# Altium schematic sheet nrf52840.SchDoc
size 381 x 241 mm; SheetNumber: 5; SheetTotal: 5
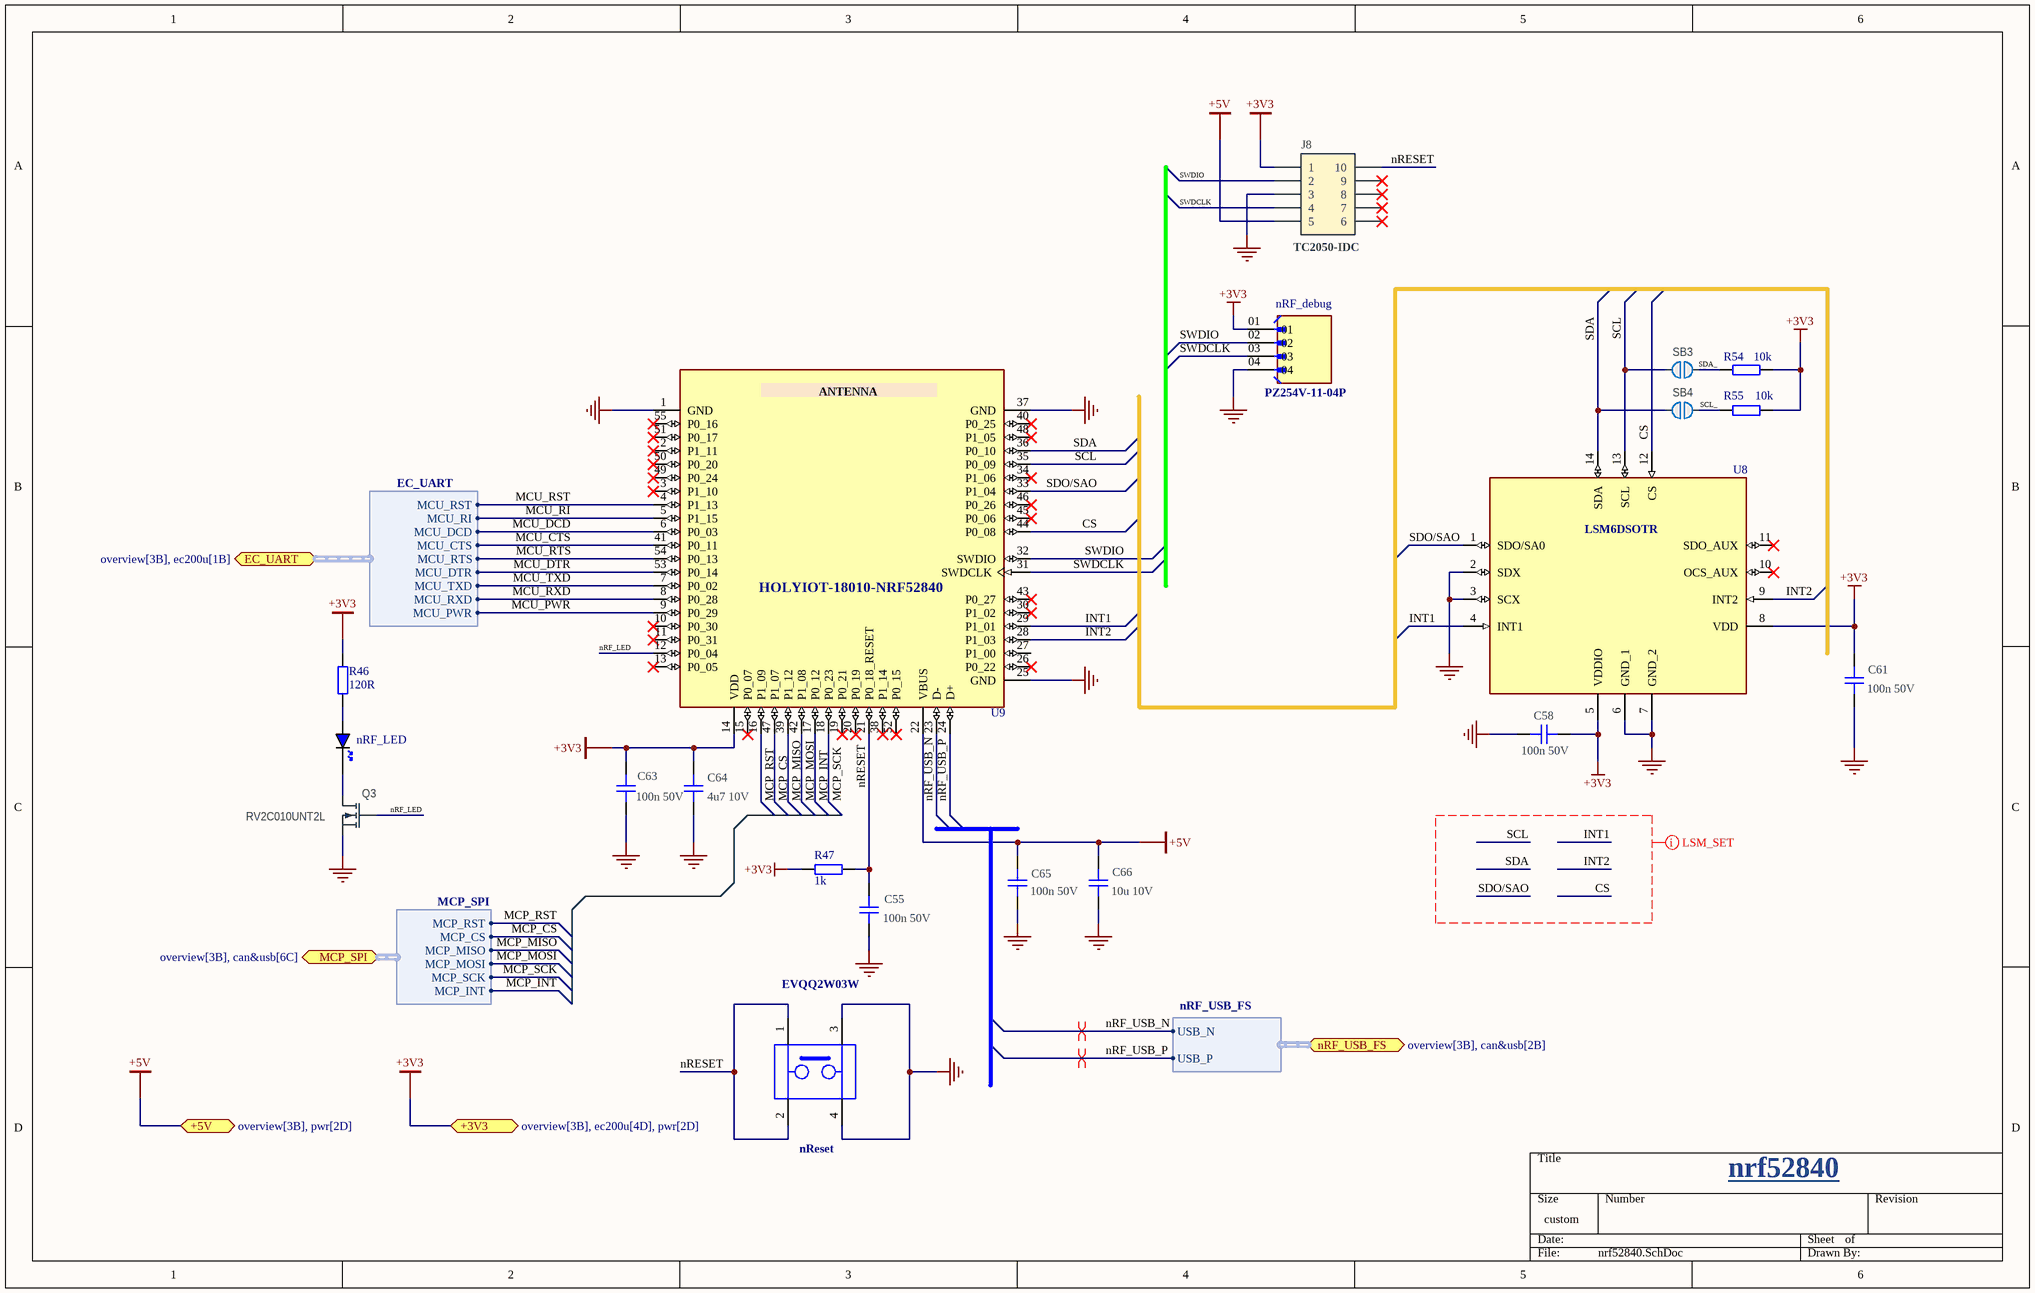
[diagram p0: nrf52840.SchDoc]

## Parts
C55  100n 50V  [CAPC1005X04L]
C58  100n 50V  [CAPC1005X04L]
C61  100n 50V  [CAPC1005X04L]
C63  100n 50V  [CAPC1005X04L]
C64  4u7 10V  [CAPC1005X04L]
C65  100n 50V  [CAPC1005X04L]
C66  10u 10V  [CAPC1005X04L]
J8  TC2050-IDC  [TC2050-IDC-NLFP]  (no BOM)
nReset  EVQQ2W03W  [EVQQ2W03W]
nRF_debug  PZ254V-11-04P  [SAMTEC_TSW-104-08-T-S-LL]
nRF_LED  BLUE  [LED_0603_BLUE]  (value not drawn)
Q3  RV2C010UNT2L  [DFN65P100X40-3L]
R46  120R  [RES_0603]
R47  1k  [RES_0603]
R54  10k  [RES_0603]
R55  10k  [RES_0603]
SB3  Solderbridge  [Solderbridge]  (value not drawn)  (no BOM)
SB4  Solderbridge  [Solderbridge]  (value not drawn)  (no BOM)
U8  LSM6DSOTR  [LSM6DSOTR]
U9  HOLYIOT-18010-NRF52840  [XCVR_HOLYIOT-18010-NRF52840]

## Ports
+3V3 (bidir, see overview[3B], ec200u[4D], pwr[2D]), +5V (bidir, see overview[3B], pwr[2D]), EC_UART (bidir, harness EC_UART, see overview[3B], ec200u[1B]), MCP_SPI (bidir, harness MCP_SPI, see overview[3B], can&usb[6C]), nRF_USB_FS (bidir, harness nRF_USB_FS, see overview[3B], can&usb[2B])

## Harnesses
EC_UART: MCU_RI, MCU_DCD, MCU_CTS, MCU_RTS, MCU_DTR, MCU_TXD, MCU_RXD, MCU_RST, MCU_PWR
nRF_USB_FS: USB_N, USB_P
MCP_SPI: MCP_RST, MCP_CS, MCP_MISO, MCP_MOSI, MCP_SCK, MCP_INT

## Nets
+3V3: C58.2 C61.1 C63.2 C64.2 J8.1 nRF_debug.01 R46.2 R47.1 R54.2 R55.2 U8.5(VDDIO) U8.8(VDD) U9.14(VDD) ; port +3V3
+5V: C65.2 C66.2 J8.5 U9.22(VBUS) ; port +5V
GND: C55.1 C58.1 C61.2 C63.1 C64.1 C65.1 C66.1 J8.3 nReset.3 nReset.4 nRF_debug.04 Q3.2(S) U8.2(SDX) U8.3(SCX) U8.6(GND_1) U8.7(GND_2) U9.1(GND) U9.25(GND) U9.37(GND)
CS: U8.12(CS) U9.44(P0_08)
INT1: U8.4(INT1) U9.29(P1_01)
INT2: U8.9(INT2) U9.28(P1_03)
MCP_CS: U9.47(P1_07) ; port MCP_SPI.MCP_CS
MCP_INT: U9.17(P0_12) ; port MCP_SPI.MCP_INT
MCP_MISO: U9.39(P1_12) ; port MCP_SPI.MCP_MISO
MCP_MOSI: U9.42(P1_08) ; port MCP_SPI.MCP_MOSI
MCP_RST: U9.16(P1_09) ; port MCP_SPI.MCP_RST
MCP_SCK: U9.18(P0_23) ; port MCP_SPI.MCP_SCK
MCU_CTS: U9.41(P0_11) ; port EC_UART.MCU_CTS
MCU_DCD: U9.6(P0_03) ; port EC_UART.MCU_DCD
MCU_DTR: U9.53(P0_14) ; port EC_UART.MCU_DTR
MCU_PWR: U9.9(P0_29) ; port EC_UART.MCU_PWR
MCU_RI: U9.5(P1_15) ; port EC_UART.MCU_RI
MCU_RST: U9.4(P1_13) ; port EC_UART.MCU_RST
MCU_RTS: U9.54(P0_13) ; port EC_UART.MCU_RTS
MCU_RXD: U9.8(P0_28) ; port EC_UART.MCU_RXD
MCU_TXD: U9.7(P0_02) ; port EC_UART.MCU_TXD
nRESET: C55.2 J8.10 nReset.1 nReset.2 R47.2 U9.21(P0_18_RESET)
nRF_LED: Q3.1(G) U9.12(P0_04)
nRF_USB_N: U9.23(D-) ; port nRF_USB_FS.USB_N
nRF_USB_P: U9.24(D+) ; port nRF_USB_FS.USB_P
SCL: SB3.2 U8.13(SCL) U9.35(P0_09)
SCL_: R55.1 SB4.1
SDA: SB4.2 U8.14(SDA) U9.36(P0_10)
SDA_: R54.1 SB3.1
SDO/SAO: U8.1(SDO/SA0) U9.33(P1_04)
SWDCLK: J8.4 nRF_debug.03 U9.31(SWDCLK)
SWDIO: J8.2 nRF_debug.02 U9.32(SWDIO)
NetnRF_LED_A: nRF_LED.A R46.1
NetnRF_LED_K: nRF_LED.K Q3.3(D)

Not connected (* = marked no-connect by the designer): J8 6* 7* 8* 9*; U8 10(OCS_AUX)* 11(SDO_AUX)*; U9 2(P1_11)* 3(P1_10)* 10(P0_30)* 11(P0_31)* 13(P0_05)* 15(P0_07)* 19(P0_21)* 20(P0_19)* 26(P0_22)* 27(P1_00) 30(P1_02)* 34(P1_06)* 38(P1_14)* 40(P0_25)* 43(P0_27)* 45(P0_06)* 46(P0_26)* 48(P1_05)* 49(P0_24)* 50(P0_20)* 51(P0_17)* 52(P0_15)* 55(P0_16)*

## Layout directives
differential pair: nRF_USB_N, nRF_USB_P
net class LSM_SET: CS, INT1, INT2, SCL, SDA, SDO/SAO

## Notes on the sheet
- nrf52840
- (in symbol HOLYIOT-18010-NRF52840) ANTENNA

## Library data of the parts
C55 C58 C61 C63 C65 = C0402-4µ7: Capacitor, X5R, ±20%; Manufacturer: N.A.; Part number IPS: 00000001251, 00000007165; Part number NEMS: 100200193; Value: 4.7µF; Note: 10V; Artikkelnr Noca: 20039482; Pad Count: 2; Component Status: Active; Part Number: C0402-4µ7; Manufacturer Part Number: N.A.; ComponentLink1URL: N.A.; ComponentLink1Description: Datasheet; ComponentLink2URL: N.A.; ComponentLink2Description: Supplier link; HelpURL: N.A.; Footprint Doc: 0402; LatestRevisionDate: 2017-11-09; Published: 2009-05-08; Supplier 1: Digi-Key; Supplier Part Number 1: 490-13252-1-ND; Supplier 2: N.A.; Supplier Part Number 2: N.A.; PartId: 100200193; Component Class: Capacitors; Author: rsk; Part number Norautron: N.A.
C64 C66 = C0402-4µ7: Capacitor, X5R, ±20%; Manufacturer: N.A.; Part number IPS: 00000001251, 00000007165; Part number NEMS: 100200193; Value: 4.7µF; Artikkelnr Noca: 20039482; Pad Count: 2; Component Status: Active; Part Number: C0402-4µ7; Manufacturer Part Number: N.A.; ComponentLink1URL: N.A.; ComponentLink1Description: Datasheet; ComponentLink2URL: N.A.; ComponentLink2Description: Supplier link; HelpURL: N.A.; Footprint Doc: 0402; LatestRevisionDate: 2017-11-09; Published: 2009-05-08; Note: 10V; Supplier 1: Digi-Key; Supplier Part Number 1: 490-13252-1-ND; Supplier 2: N.A.; Supplier Part Number 2: N.A.; PartId: 100200193; Component Class: Capacitors; Author: rsk; Part number Norautron: N.A.
J8 = TC2050-IDC-NLFP: CBL PLUG-OF-NAILS 10-PIN; Manufacturer: Tag-Connect LLC; Part number NEMS: 100500463; Artikkelnr Noca: N.A.; Pad Count: 10; Component Status: Active; System: Connector; Part Number: TC2050-IDC-NLFP; Manufacturer Part Number: TC2050-IDC-NLFP; LatestRevisionDate: 2012-11-21; Published: 2012-11-21; Value: TC2050-IDC; Footprint Doc: TC2050-IDC-NLFP; Part number IPS: N.A.; ComponentLink1URL: N.A.; ComponentLink1Description: Datasheet; ComponentLink2URL: N.A.; ComponentLink2Description: Supplier link; HelpURL: http://www.tag-connect.com/Materials/TC2050-IDC%20Datasheet.pdf; Supplier 1: Digi-Key; Supplier Part Number 1: TC2050-IDC-NL-ND; Supplier 2: N.A.; Supplier Part Number 2: N.A.; PartId: 100500463; Component Class: Connectors; Note: N.A.; Author: rsk; Part number Norautron: N.A.
nReset = EVQQ2W03W: White Push Plate Tactile Switch, SPST-NO 20 mA 3.1mm; MF: Panasonic; Package: None; Check_prices: https://www.snapeda.com/parts/EVQQ2W03W/Panasonic/view-part/?ref=eda; SnapEDA_Link: https://www.snapeda.com/parts/EVQQ2W03W/Panasonic/view-part/?ref=snap; Price: None; Availability: In Stock; MP: EVQQ2W03W; Value: *
nRF_debug = 4PIN_TSW-104-08-T-S-LL: MF: Samtec; Availability: Unavailable; Value: *; Package: None; Price: None; MP: TSW-104-08-T-S-LL
nRF_LED = LED_0603_BLUE: LED 0603 BLUE SMD
Q3 = RV2C010UNT2L: N-Channel MOSFET, 20V, 1A, 470mOhm, 400mW; Manufacturer: Rohm Semiconductor; Part number IPS: 00000009976; Part number Norautron: 26320026; Part number NEMS: 101300132; Note: N.A.; Artikkelnr Noca: 35010020; Pad Count: 3; Component Status: Active; Part Number: RV2C010UNT2L; Manufacturer Part Number: RV2C010UNT2L; ComponentLink1URL: N.A.; ComponentLink1Description: Datasheet; ComponentLink2URL: N.A.; ComponentLink2Description: Supplier link; HelpURL: http://rohmfs.rohm.com/en/products/databook/datasheet/discrete/transistor/mosfet/rv2c010unt2l-e.pdf; Footprint Doc: DFN-3; LatestRevisionDate: 2016-08-09; Published: 2016-08-09; Value: RV2C010UNT2L; Supplier 1: Digi-Key; Supplier Part Number 1: RV2C010UNT2LCT-ND; Supplier 2: Mouser; Supplier Part Number 2: 755-RV2C010UNT2L; PartId: 101300132; Component Class: Semiconductors; Author: rsk
R46 R47 R54 R55 = RES_0603: Resistor SMD 0603; Manufacturer: *; Manufacturer Part Number: *; Distributor Link: *; LCSC: *
SB3 SB4 = Solderbridge: Manufacturer: N.A.; Part number NEMS: 100500458; Pad Count: 2; Component Status: Active; System: Connector; Part Number: Solderbridge; Manufacturer Part Number: N.A.; LatestRevisionDate: 2009-12-14; Published: 2009-12-14; Value: Solderbridge; Note: N.A.; Artikkelnr Noca: N.A.; Footprint Doc: Solderbridge; Part number IPS: N.A.; ComponentLink1URL: N.A.; ComponentLink1Description: Datasheet; ComponentLink2URL: N.A.; ComponentLink2Description: Supplier link; HelpURL: N.A.; Supplier 1: N.A.; Supplier Part Number 1: N.A.; Supplier 2: N.A.; Supplier Part Number 2: N.A.; PartId: 100500458; Component Class: Connectors; Author: rsk; Part number Norautron: N.A.
U8 = LSM6DSOTR: Accelerometer, Gyroscope, 6 Axis Sensor I2C, SPI Output; MF: STMicroelectronics; SnapEDA_Link: https://www.snapeda.com/parts/LSM6DSOTR/STMicroelectronics/view-part/?ref=snap; Package: VFLGA-14 STMicroelectronics; Value: *; MP: LSM6DSOTR; Check_prices: https://www.snapeda.com/parts/LSM6DSOTR/STMicroelectronics/view-part/?ref=eda
U9 = HOLYIOT-18010-NRF52840: Holyiot 18010 Nordic nRF52840 module Bluetooth low energy module; SnapEDA_Link: https://www.snapeda.com/parts/HOLYIOT-18010-NRF52840/Holyiot/view-part/?ref=snap; Package: Package; Value: *; MF: Holyiot; MP: HOLYIOT-18010-NRF52840; Check_prices: https://www.snapeda.com/parts/HOLYIOT-18010-NRF52840/Holyiot/view-part/?ref=eda